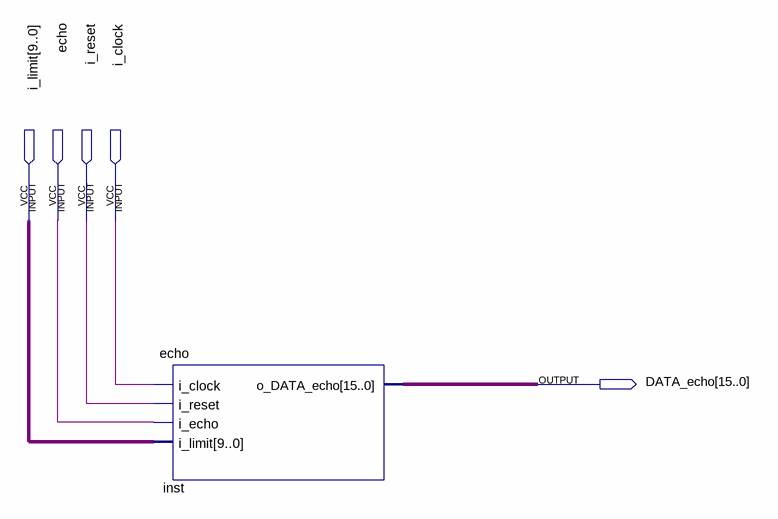
[diagram p0: schematic sheet]
// Quartus schematic echo_2.bdf as structural Verilog: 1 symbols, 5 pins
module echo_2 (
  input  [9:0] i_limit,
  input  echo,
  input  i_reset,
  input  i_clock,
  output [15:0] DATA_echo
);

  echo inst (.i_clock(i_clock), .i_reset(i_reset), .i_echo(echo), .i_limit(i_limit), .o_DATA_echo(DATA_echo));
endmodule
